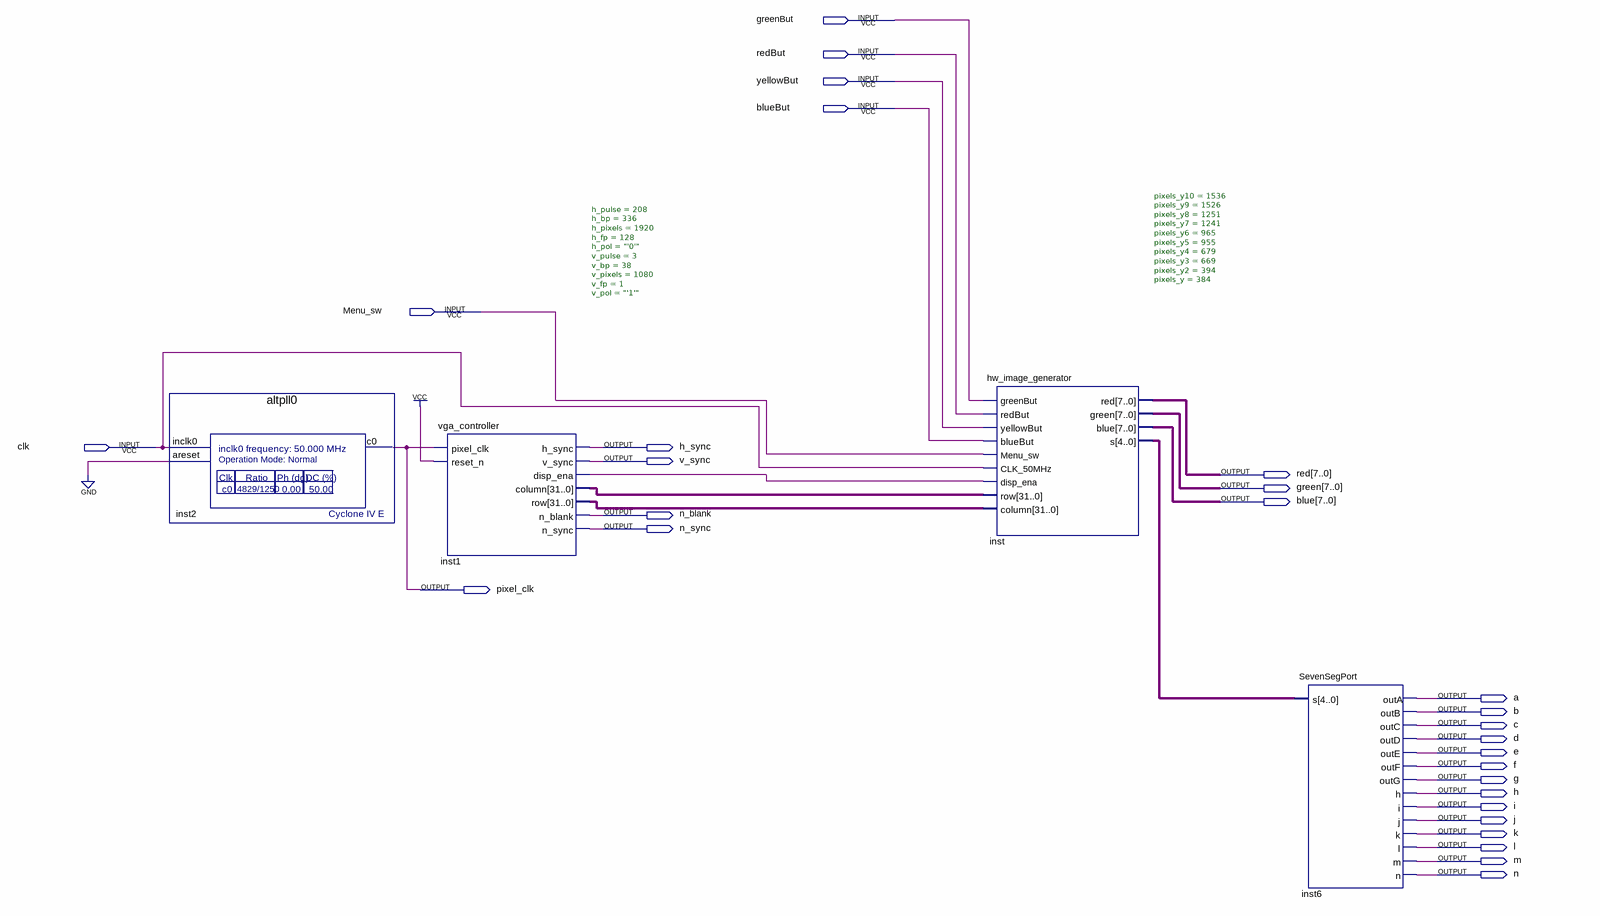
[diagram p0: schematic sheet]
// Quartus schematic vga_with_hw_test_image.bdf as structural Verilog: 4 symbols, 28 pins
module vga_with_hw_test_image (
  input  greenBut,
  input  redBut,
  input  yellowBut,
  input  blueBut,
  input  Menu_sw,
  input  clk,
  output h_sync,
  output v_sync,
  output [7:0] red,
  output [7:0] green,
  output [7:0] blue,
  output n_blank,
  output n_sync,
  output pixel_clk,
  output a,
  output b,
  output c,
  output d,
  output e,
  output f,
  output g,
  output h,
  output i,
  output j,
  output k,
  output l,
  output m,
  output n
);

  wire inst1_disp_ena;
  wire [4:0] inst_s;
  wire [31:0] inst1_column, inst1_row;

  altpll0 inst2 (.inclk0(clk), .areset(1'b0), .c0(pixel_clk));
  vga_controller #(.h_pulse(208), .h_bp(336), .h_pixels(1920), .h_fp(128), .h_pol("'0'"), .v_pulse(3), .v_bp(38), .v_pixels(1080), .v_fp(1), .v_pol("'1'")) inst1 (
    .pixel_clk(pixel_clk), .reset_n(1'b1), .h_sync(h_sync), .v_sync(v_sync), .disp_ena(inst1_disp_ena),
    .column(inst1_column), .row(inst1_row), .n_blank(n_blank), .n_sync(n_sync));
  hw_image_generator #(.pixels_y10(1536), .pixels_y9(1526), .pixels_y8(1251), .pixels_y7(1241), .pixels_y6(965), .pixels_y5(955), .pixels_y4(679), .pixels_y3(669), .pixels_y2(394), .pixels_y(384)) inst (
    .greenBut(greenBut), .redBut(redBut), .yellowBut(yellowBut), .blueBut(blueBut), .Menu_sw(Menu_sw),
    .CLK_50MHz(clk), .disp_ena(inst1_disp_ena), .row(inst1_column), .column(inst1_row), .red(red),
    .green(green), .blue(blue), .s(inst_s));
  SevenSegPort inst6 (
    .s(inst_s), .outA(a), .outB(b), .outC(c), .outD(d), .outE(e), .outF(f), .outG(g), .h(h), .i(i), .j(j),
    .k(k), .l(l), .m(m), .n(n));
endmodule
